# Altium project Team_Deamos_PCB_Simplified.PrjPcb
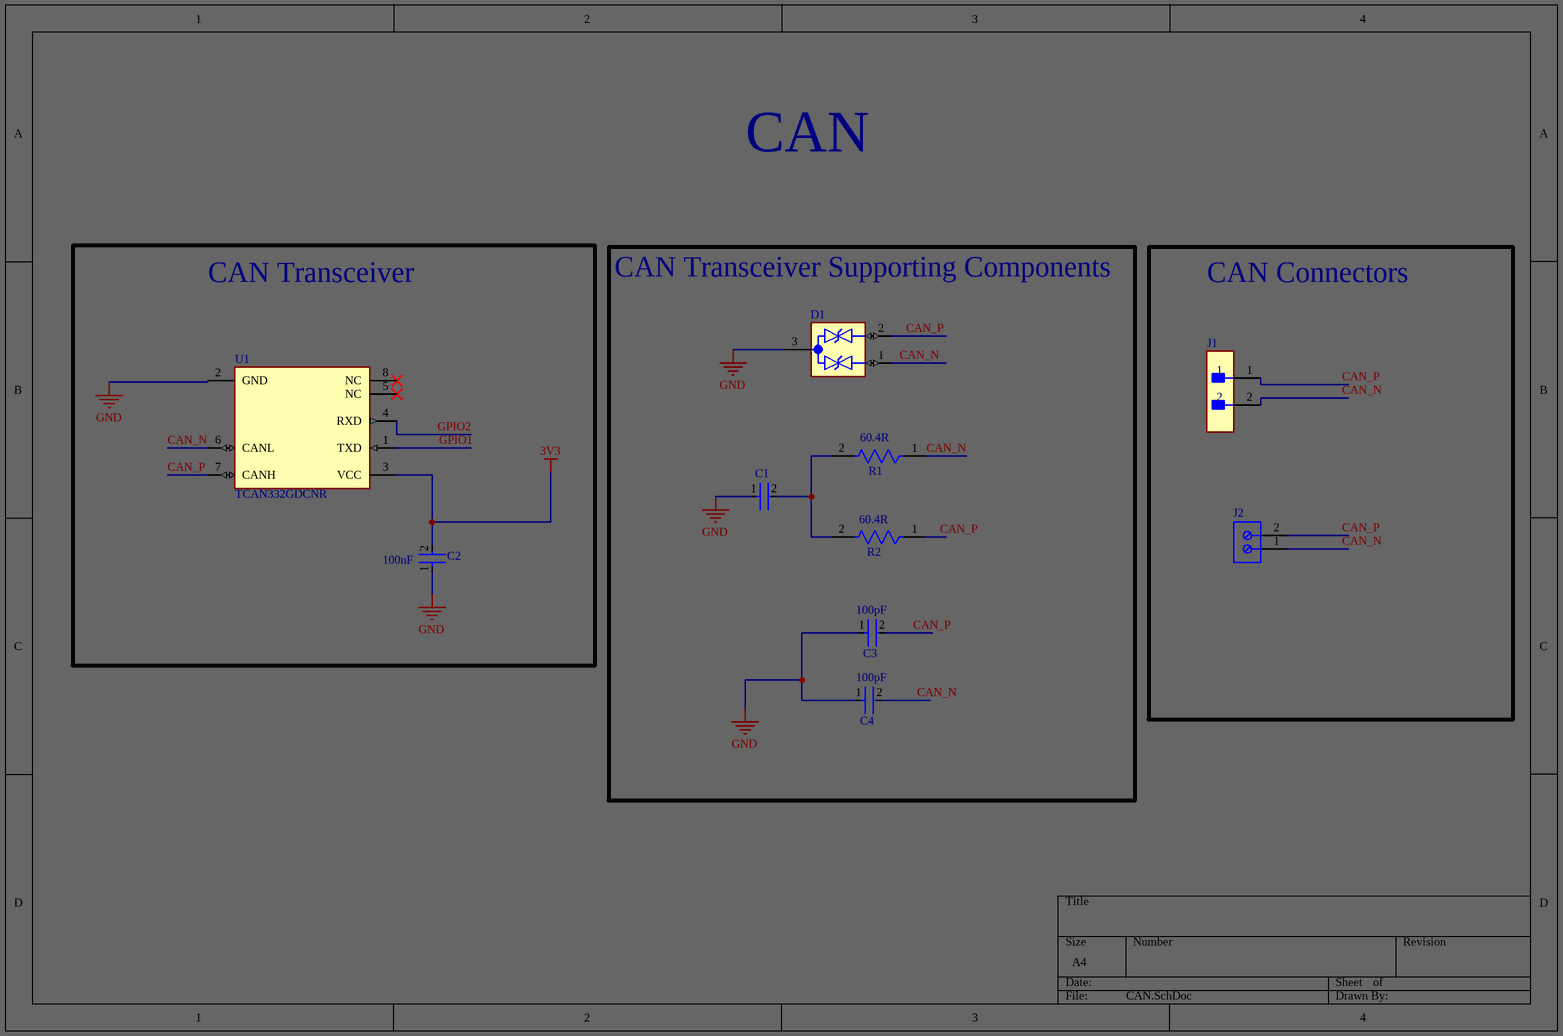
[diagram p0: CAN.SchDoc]
2 sheets, 28 parts. Net scope: global (net labels, ports and power ports of the same name join across sheets).
Board files: PCB1.PcbDoc, PCB1_rev2.PcbDoc
Sheets:
  CAN.SchDoc
  Sheet1.SchDoc

## Sheet CAN.SchDoc
size A4; SheetNumber: 2; SheetTotal: 3

### Parts
C1  CC0402KRX7R6BB472  [FP-CC0402-MFG]  (value not drawn)
C2  Capacitance: 100nF  [FP-CL17-IPC_C]  (hidden comment: CL05B104KP5NNNC)
C3  value 100pF  [FP-CL05-MFG]  (hidden comment: CL05C101JB5NNNC)
C4  value 100pF  [FP-CL05-MFG]  (hidden comment: CL05C101JB5NNNC)
D1  ESD2CAN24DBZRQ1  [SOT95P237X112-3N]  (value not drawn)
J1  M20-9990246  [FP-M20-9990246-MFG]  (value not drawn)
J2  691137710002  [691137710002]  (value not drawn)
R1  Resistance: 60.4R  [FP-ERJ2RK-IPC_A]  (hidden comment: ERJ-2RKF60R4X)
R2  Resistance: 60.4R  [FP-ERJ2RK-IPC_A]  (hidden comment: ERJ-2RKF60R4X)
U1  TCAN332GDCNR  [FP-DCN0008A-IPC_A]

### Blocks framed on the sheet
CAN Transceiver: C2 U1
CAN Transceiver Supporting Components: C1 C3 C4 D1 R1 R2
CAN Connectors: J1 J2

### Nets
3V3: C2.2 U1.3(VCC)
GND: C1.1 C2.1 C3.1 C4.1 D1.3(GND) U1.2(GND)
CAN_N: C4.2 D1.1(IO1) J1.2 J2.1 R1.1 U1.6(CANL)
CAN_P: C3.2 D1.2(IO2) J1.1 J2.2 R2.1 U1.7(CANH)
GPIO1: U1.1(TXD)
GPIO2: U1.4(RXD)
NetC1_2: C1.2 R1.2 R2.2

Not connected (* = marked no-connect by the designer): U1 5(NC)* 8(NC)*

### Notes on the sheet
- CAN

### Library data of the parts
C1 = CMP-03422-001343-1: CC0402 4.7 nF X7R 10.00% 10 V; Manufacturer: YAGEO; Tolerance: 0.1; Material: Ceramic; Temperature Coefficient: 30ppm/°C; Value: 4.7 nF; Automotive Grade: NA; Voltage Rating: 10 V; Device Class L3: Ceramic Capacitors; RoHS: TRUE; Manufacturer Part Number: CC0402KRX7R6BB472; Temperature Range High: +125°C; Device Class L1: Passive Components; Capacitance: 4.7 nF; Device Class L2: Capacitors; Temperature Characteristic: X7R; Mouser Description: Cap Ceramic 0.0047uF 10V X7R 10% SMD 0402 125°C Paper T/R; Lead Free: Yes; ComponentLink2Description: Datasheet; Footprint Url: http://www.yageo.com/exep/pages/download/literatures/UPY-C_GEN_24.pdf; Category: Cap; ComponentLink2URL: http://www.yageo.com/documents/recent/UPY-GP_NP0_16V-to-50V_16.pdf; Ipc Land Pattern Name: CAPC10050X50; Automotive: No; Package: CC0402; Octopart: https://octopart.com/cc0402krx7r6bb472-yageo-90326733; Temperature: -55°C to +125°C; Height: 0.55mm; Temperature Range Low: -55°C
C2 = CMP-13271-001069-1: Cap Ceramic 100nF 10V X7R ±10% SMD 0402 +125°C Paper T/R; Height: 0.5mm; Case/Package: 0402; Contact Plating: Tin; Case Code (Imperial): 0402; Thickness: 0.022inch; Min Operating Temperature: -55°C; Package Quantity: 1; Length: 1mm; Max Operating Temperature: 125°C; Depth: 0.5mm; Voltage Rating: 10V; Packaging: Tape and Reel; Mount: Surface Mount; Tolerance: 10%; Width: 0.02inch; Radiation Hardening: No; Case Code (Metric): 1005; Dielectric: X7R
C3 C4 = CMP-13271-000010-1: CAP CER 100PF 50V C0G/NP0 0402; Manufacturer: Samsung; Tolerance: 5%; Temperature Characteristic: C0G; Material: Ceramic; Temperature Coefficient: 30ppm/°C; Capacitance: 100pF; Package: CL05; Device Class L1: Passive Components; Automotive: No; Ipc Land Pattern Name: CAPC10050X50; ComponentLink2URL: http://www.samsungsem.com/global/front/downloadcms.do?path=%2F%2Fglobal%2F%2Fsupport%2F%2Fproduct-search%2F%2Fmlcc%2F%2F__icsFiles%2F%2Fafieldfile%2F%2F2019%2F%2F06%2F%2F18&fileName=CL05C101JB5NNNC-19.pdf; Temperature: -55°C to +125°C; Device Class L2: Capacitors; Digikey Description: CAP CER 100PF 50V C0G/NP0 0402; Octopart: https://octopart.com/cl05c101jb5nnnc-samsung-9299367; Manufacturer Part Number: CL05C101JB5NNNC; Temperature Range High: +125°C; Temperature Range Low: -55°C; Lead Free: Yes; ComponentLink2Description: Datasheet; RoHS: TRUE; Device Class L3: Ceramic Capacitors; Height: 0.55mm; Voltage Rating: 50V; Category: Cap
D1 = ESD2CAN24DBZRQ1: Automotive, dual, 3-pF, ±24-V, ±30-kV ESD protection diode for CAN and in-vehicle networks 3-SOT-23 -55 to 150; Manufacturer: Texas Instruments; Supplier: Digikey; Supplier Part Number: 296-ESD2CAN24DBZRQ1CT-ND; Manufacturer Part Number: ESD2CAN24DBZRQ1; RoHS: No; Category: Integrated Circuits (ICs); Stock: 12405; Pricing: 1=0.22, 10=0.149, 25=0.1316, 100=0.1125, 250=0.10328, 500=0.09774, 1000=0.09319 (USD)
J1 = CMP-15831-000009-1: CONN HEADER VERT 2POS 2.54MM; Manufacturer: Harwin; Conn Gender: Male; Conn Orientation: Vertical; Number Of Contacts: 2; Current Rating: 3A; ComponentLink2URL: https://cdn.harwin.com/pdfs/M20-999.pdf; ComponentLink2Description: Datasheet; Package: M20-9990246; Temperature: -40°C to +105°C; Octopart: https://octopart.com/m20-9990246-harwin-2590635; Mouser Description: 2.54mm (0.1") Pitch SIL Vertical PC Tail Pin Header, 6.1mm mating pin height, tin, 2 contacts; Temperature Range High: +105°C; Device Class L1: Connectors; RoHS: TRUE; Automotive: No; Height: 8.99mm; Number Of Rows: 1; Contact Material: Tin,Nickel; Category: Conn; Pitch: 2.54mm; Lead Free: Yes; Digikey Description: CONN HEADER VERT 2POS 2.54MM; Manufacturer Part Number: M20-9990246; Temperature Range Low: -40°C; Device Class L3: unset; Device Class L2: Headers and Wire Housings
J2 = CMP-1502-03324-2: NexarPartId: 78871135; Voltage Rating: 300V; Number of Contacts: 2; Current Rating: 16A; Lead Pitch: 5mm; Height: 11.6mm; Packaging: Box; RoHS: Non-Compliant; Contact Material: Nickel, Tin; Max Operating Temperature: 120°C; Number of Pins: 2; Min Operating Temperature: -30°C; Number of Rows: 1
R1 R2 = CMP-2002-01013-2: RES SMD 60.4 OHM 1% 1/10W 0402; Voltage Rating (DC): 50V; Temperature Coefficient: 100ppm/°C; Max Power Dissipation: 100mW; Height: 0.016inch; Series: ERJ; Min Operating Temperature: -55°C; Package Quantity: 1; Case/Package: 0402; Resistance Tolerance: 1%; Termination: SMD/SMT; Case Code (Imperial): 0402; Contact Plating: Tin; Resistor Type: Thick Film; Voltage Rating: 50V; Depth: 0.5mm; Features: Automotive AEC-Q200; Power Rating: 100mW; Tolerance: 1%; Max Operating Temperature: 155°C; Mount: Surface Mount; Lead Free: Contains Lead; Military Standard: Not; Case Code (Metric): 1005; Construction: Rectangular; Number of Terminations: 2; RoHS Compliant: Yes; REACH SVHC: No SVHC; Packaging: Tape and Reel; Width: 0.02inch; Length: 1mm
U1 = CMP-04872-000119-1: IC TRANSCEIVER 1/1 SOT23-8; Receiver Hysteresis: 120mV; Data Rate: 5Mbps; Case/Package: SOT-23-8; Mount: Surface Mount; Lead Free: Lead Free; Min Operating Temperature: -40°C; Max Operating Temperature: 125°C; Packaging: Tape and Reel; RoHS Compliant: Yes

## Sheet Sheet1.SchDoc
size A4; SheetNumber: 3; SheetTotal: 2
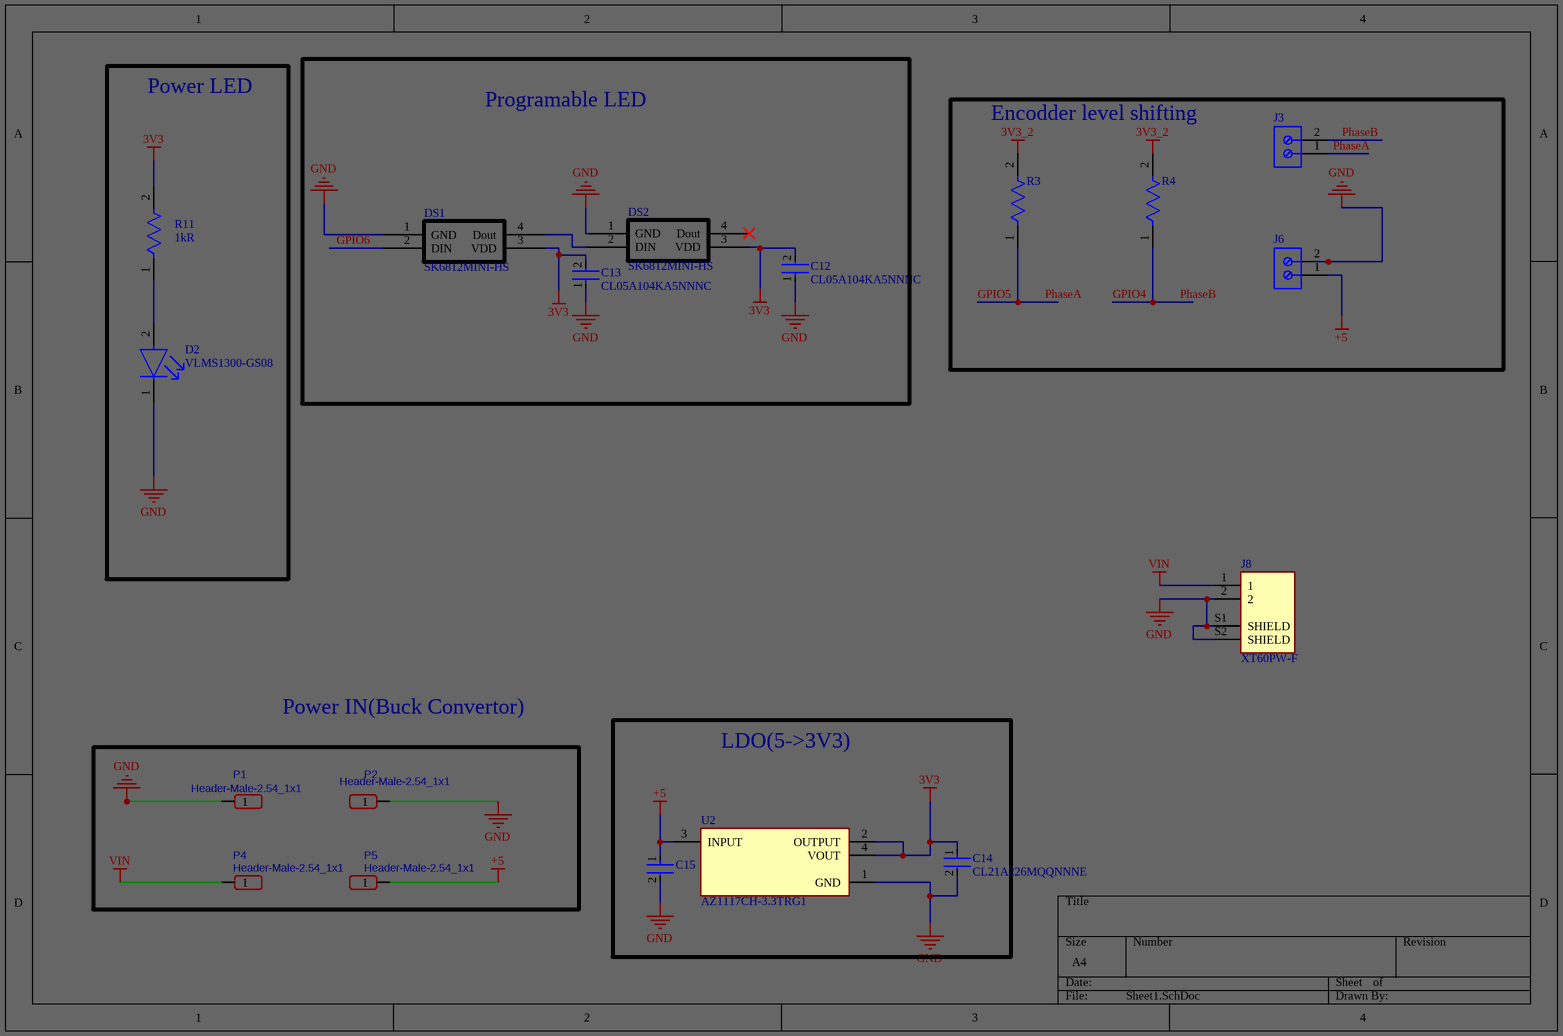
[diagram p1: Sheet1.SchDoc]

### Parts
C12  CL05A104KA5NNNC  [FP-CL278-IPC_C]
C13  CL05A104KA5NNNC  [FP-CL278-IPC_C]
C14  CL21A226MQQNNNE  [FP-CL21-IPC_A]
C15  CL05A106MP5NUNC  [FP-CL05A106MP5NUNC-MFG]  (value not drawn)
D2  VLMS1300-GS08  [FP-6_541-5092_01-4-MFG]
DS1  SK6812MINI-HS  [LED]
DS2  SK6812MINI-HS  [LED]
J3  691137710002  [691137710002]  (value not drawn)
J6  691137710002  [691137710002]  (value not drawn)
J8  XT60PW-F  [AMASS_XT60PW-F]
P1  Header-Male-2.54_1x1  [PCBComponent_1]
P2  Header-Male-2.54_1x1  [PCBComponent_1]
P4  Header-Male-2.54_1x1  [PCBComponent_1]
P5  Header-Male-2.54_1x1  [PCBComponent_1]
R3  RC0402JR-074K7L  [FP-RC0402-0_4-MFG]  (value not drawn)
R4  RC0402JR-074K7L  [FP-RC0402-0_4-MFG]  (value not drawn)
R11  Resistance: 1kR  [FP-CRCW0603-e3-MFG]  (hidden comment: CRCW06031K00FKEA)
U2  AZ1117CH-3.3TRG1  [FP-SOT223-MFG]

### Blocks framed on the sheet
Power LED: D2 R11
Programable LED: C12 C13 DS1 DS2
Encodder level shifting: J3 J6 R3 R4
LDO(5->3V3): C14 C15 U2

### Nets
3V3: C12.2 C13.2 C14.1 DS1.3(VDD) DS2.3(VDD) R11.2 U2.2(OUTPUT) U2.4(VOUT)
3V3_2: R3.2 R4.2
+5: C15.1 J6.1 P5.1 U2.3(INPUT)
GND: C12.1 C13.1 C14.2 C15.2 D2.1(C) DS1.1(GND) DS2.1(GND) J6.2 J8.2 J8.S1(SHIELD) J8.S2(SHIELD) P1.1 P2.1 U2.1(GND)
VIN: J8.1 P4.1
GPIO4: J3.2 R4.1  [also labelled PhaseB]
GPIO5: J3.1 R3.1  [also labelled PhaseA]
GPIO6: DS1.2(DIN)
NetD2_2: D2.2(A) R11.1
NetDS1_4: DS1.4(Dout) DS2.2(DIN)

Not connected (* = marked no-connect by the designer): DS2 4(Dout)*

### Notes on the sheet
- Power IN(Buck Convertor)

### Library data of the parts
C12 C13 = CMP-13271-000728-1: Cap Ceramic 100nF 25V X5R ±10% SMD 0402 +85°C Paper T/R; Package Quantity: 1; Height: 0.5mm; Case Code (Metric): 1005; Thickness: 0.022inch; Mount: Surface Mount; Lead Free: Lead Free; Case Code (Imperial): 0402; Packaging: Tape and Reel; Depth: 0.5mm; Voltage: 25V; Min Operating Temperature: -55°C; Voltage Rating: 25V; Dielectric: X5R; Case/Package: 0402; Tolerance: 10%; Width: 0.02inch; Max Operating Temperature: 85°C; Capacitance: 100nF; Length: 1mm; Radiation Hardening: No; Voltage Rating (DC): 25V
C14 = CMP-13271-000185-1: CL21 Series 0805 22uF 6.3V ±20% Tolerance X5R Multilayer Ceramic Chip Capacitor; Height: 1.25mm; Length: 2mm; Capacitance: 22uF; Mount: Surface Mount; Dielectric: X5R; Voltage Rating (DC): 6.3V; Case Code (Metric): 2012; Depth: 1.25mm; Max Operating Temperature: 85°C; Voltage Rating: 6.3V; Width: 0.049inch; Case/Package: 0805; Radiation Hardening: No; Thickness: 0.055inch; Packaging: Tape and Reel; Package Quantity: 2000; Lead Free: Lead Free; Contact Plating: Tin; Min Operating Temperature: -55°C; Case Code (Imperial): 0805; Tolerance: 20%
C15 = CMP-13271-000002-1: CAP CER 10UF 10V X5R 0402; Manufacturer: Samsung; Temperature Coefficient: 15%; Tolerance: 20%; Description: Cap Ceramic 10uF 10V X5R 20% SMD 0402 85C T/R; Material: Ceramic; Octopart: https://octopart.com/cl05a106mp5nunc-samsung-22457395; Voltage Rating: 10V; RoHS: TRUE; Value: 10uF; Height: 0.7mm; Digikey Description: CAP CER 10UF 10V X5R 0402; Automotive: No; Package: CL05A106MP5NUNC; Device Class L1: Passive Components; Capacitance: 10uF; Temperature Range High: +85°C; ComponentLink2Description: Datasheet; Device Class L2: Capacitors; Temperature Characteristic: X5R; Manufacturer Part Number: CL05A106MP5NUNC; Temperature: -55°C to +85°C; ComponentLink2URL: http://www.samsungsem.com/kr/support/product-search/mlcc/__icsFiles/afieldfile/2019/05/10/19-CL05A106MP5NUNC.pdf; Device Class L3: Ceramic Capacitors; Category: Cap; Temperature Range Low: -55°C; Ipc Land Pattern Name: CAPC10050X50; Lead Free: Yes
D2 = CMP-02520-000012-1: LED RED 0603 SMD; Manufacturer: Vishay; Forward Voltage: 2V; Reverse Voltage: 5V; Power Dissipation: 75mW; Forward Current: 20mA; Luminous Intensity: 54mcd; Led Orientation: Top View; Peak Emmision Wavelength: 639nm; Viewing Angle: 130°; Wavelength: 631nm; Digikey Description: LED RED 0603 SMD; Height: 1mm; Colour: Red; Ambient Temperature Range High: +85°C; Ambient Temperature Range Low: -35°C; Package: 6.541-5092.01-4; Automotive: No; Temperature Range High: +85°C; Device Class L3: unset; Lead Free: Yes; Temperature Range Low: -35°C; Temperature: -35°C to +85°C; Manufacturer Part Number: VLMS1300-GS08; Device Class L2: LEDs; ComponentLink2Description: Datasheet; Octopart: https://octopart.com/vlms1300-gs08-vishay-21709201; Device Class L1: Optoelectronics; RoHS: TRUE; ComponentLink2URL: http://www.vishay.com/docs/82437/vlmo1300.pdf; Mouser Description: Standard LEDs - SMD Super Red Clear Non-Diff; Category: Diode
J3 J6 = CMP-1502-03324-2: as J2 on sheet CAN; Lead Pitch: 5mm; Height: 11.6mm; Packaging: Box; RoHS: Non-Compliant; Contact Material: Nickel, Tin; Max Operating Temperature: 120°C; Number of Pins: 2; Min Operating Temperature: -30°C; Number of Rows: 1
J8 = XT60PW-F: Socket DC Supply Connector Female; MF: AMASS; SnapEDA_Link: https://www.snapeda.com/parts/XT60PW-F/AMASS/view-part/?ref=snap; Package: Package; Availability: Not in stock; Price: None; Check_prices: https://www.snapeda.com/parts/XT60PW-F/AMASS/view-part/?ref=eda; MP: XT60PW-F; Value: *
P1 P2 P4 P5 = Header-Male-2.54_1x1: Manufacturer: BOOMELE(博穆精密); Manufacturer Part: 2.54-1*1P针; Supplier: LCSC; Supplier Part: C81276; JLCPCB Part Class: Extended Part; spicePre: P; spiceSymbolName: Header-Male-2.54_1x1
R3 R4 = CMP-2002-08011-2: Tolerance: 5%; Power Rating: 63mW; Resistance: 4.7kΩ; Voltage Rating: 50V; Temperature Coefficient: 100ppm/°C; Composition: Thick Film; Max Operating Temperature: 155°C; Case/Package: 0402; Depth: 500µm; Packaging: Tape & Reel; Number of Pins: 2; Schedule B: 8533210045, 8533210045; Case Code (Imperial): 0402; Termination: SMD/SMT; Military Standard: Not; Lead Free: Lead Free; Width: 500µm; REACH SVHC: No SVHC; Max Power Dissipation: 63mW; Voltage Rating (AC): 50V; Features: Moisture Resistant; Min Operating Temperature: -55°C; Number of Terminations: 2; RoHS: Compliant; Height: 350µm; Voltage Rating (DC): 50V; Length: 1mm
R11 = CMP-1666-00003-5: RES Thick Film, 1kΩ, 1%, 0.1W, 100ppm/°C, 0603; Max Power Dissipation: 100mW; Voltage Rating: 75V; Value: 1kR; Max Operating Temperature: 155°C; Number of Pins: 2; Case Code (Imperial): 0603; Width: 0.033inch; Power Rating: 100mW; Number of Terminations: 2; Package Quantity: 10; Weight: 7.1E-05oz; Tolerance: 1%; Temperature Coefficient: 100ppm/°C; Military Standard: Not; Mount: Surface Mount; Voltage Rating (DC): 75V; Depth: 0.85mm; Composition: Thick Film; Radiation Hardening: No; Termination: SMD/SMT; Length: 1.55mm; Case Code (Metric): 1608; Contact Plating: Tin; Min Operating Temperature: -55°C; Packaging: Tape and Reel; Height: 0.45mm; Lead Free: Lead Free; Case/Package: 0603; Features: Automotive AEC-Q200
U2 = CMP-12756-000028-1: IC REG LINEAR 3.3V 800MA SOT223; Accuracy: 1%; Reference Voltage: 1.262V; Quiescent Current: 6mA; Power Supply Rejection Ratio (PSRR): 70dB; Max Input Voltage: 15V; Max Output Current: 1.35A; Output Type: Fixed; Min Current Limit: 1A; Number of Regulators: 1; Polarity: Positive; Dropout Voltage: 1.2V; Output Current: 800mA; Width: 3.7mm; Case/Package: SOT-223; Length: 6.7mm; Mount: Surface Mount; Output Voltage: 3.3V; Lead Free: Lead Free; Min Operating Temperature: -20°C; Packaging: Tape and Reel; Package Quantity: 4000; Max Operating Temperature: 125°C; Number of Pins: 4; Number of Outputs: 1; Height: 1.7mm

## Nets that join several sheets
3V3: CAN (C2.2 U1.3), Sheet1 (8 pins)
GND: CAN (6 pins), Sheet1 (14 pins)